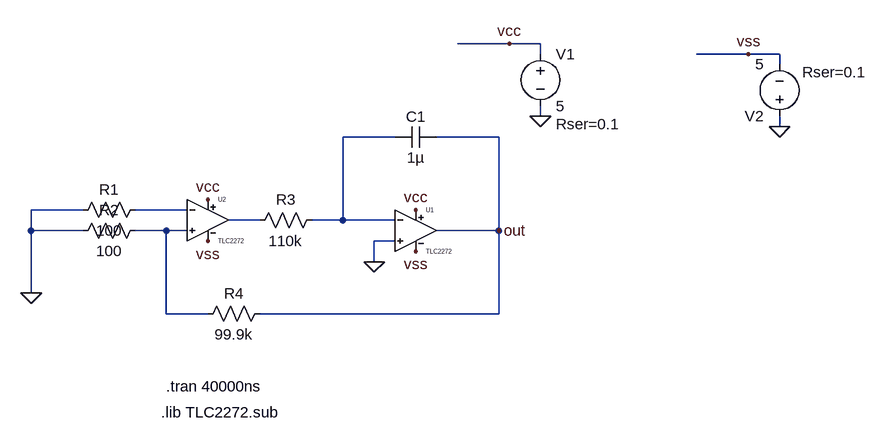
[diagram p0: schematic measure_opamp_offset.asc]
measure_opamp_offset.asc, the LTspice schematic file:
Version 4
SHEET 1 1132 680
WIRE 224 -16 144 -16
WIRE 272 -16 224 -16
WIRE 272 0 272 -16
WIRE 592 0 512 0
WIRE 640 0 592 0
WIRE 640 16 640 0
WIRE 272 96 272 80
WIRE 640 112 640 96
WIRE 48 128 -32 128
WIRE 208 128 112 128
WIRE -432 240 -512 240
WIRE -272 240 -352 240
WIRE -160 256 -208 256
WIRE -32 256 -32 128
WIRE -32 256 -80 256
WIRE 48 256 -32 256
WIRE -512 272 -512 240
WIRE -432 272 -512 272
WIRE -304 272 -352 272
WIRE -272 272 -304 272
WIRE 208 272 208 128
WIRE 208 272 112 272
WIRE 48 288 16 288
WIRE 16 320 16 288
WIRE -512 368 -512 272
WIRE -304 400 -304 272
WIRE -240 400 -304 400
WIRE 208 400 208 272
WIRE 208 400 -160 400
FLAG 272 96 0
FLAG 224 -16 vcc
FLAG 640 112 0
FLAG 592 0 vss
FLAG -512 368 0
FLAG 16 320 0
FLAG 208 272 out
FLAG -240 224 vcc
FLAG 80 240 vcc
FLAG -240 288 vss
FLAG 80 304 vss
SYMBOL voltage 272 -16 R0
WINDOW 123 0 0 Left 2
WINDOW 39 24 124 Left 2
SYMATTR SpiceLine Rser=0.1
SYMATTR InstName V1
SYMATTR Value 5
SYMBOL Opamps\\TLC2272 -240 192 R0
SYMATTR InstName U2
SYMBOL res -336 224 R90
WINDOW 0 0 56 VBottom 2
WINDOW 3 32 56 VTop 2
SYMATTR InstName R1
SYMATTR Value 100
SYMBOL res -336 256 R90
WINDOW 0 0 56 VBottom 2
WINDOW 3 32 56 VTop 2
SYMATTR InstName R2
SYMATTR Value 100
SYMBOL res -64 240 R90
WINDOW 0 0 56 VBottom 2
WINDOW 3 32 56 VTop 2
SYMATTR InstName R3
SYMATTR Value 110k
SYMBOL res -144 384 R90
WINDOW 0 0 56 VBottom 2
WINDOW 3 32 56 VTop 2
SYMATTR InstName R4
SYMATTR Value 99.9k
SYMBOL cap 112 112 R90
WINDOW 0 0 32 VBottom 2
WINDOW 3 32 32 VTop 2
SYMATTR InstName C1
SYMATTR Value 1µ
SYMBOL Opamps\\TLC2272 80 208 R0
SYMATTR InstName U1
SYMBOL voltage 640 112 R180
WINDOW 123 0 0 Left 2
WINDOW 39 -134 84 Left 2
SYMATTR SpiceLine Rser=0.1
SYMATTR InstName V2
SYMATTR Value 5
TEXT -304 512 Left 2 !.tran 40000ns
TEXT -312 552 Left 2 !.lib TLC2272.sub

The netlist it stands for:
* measure_opamp_offset.asc
V1 vcc 0 5 Rser=0.1
XU2 N004 N002 vcc vss N003 TLC2272  ; pins In+ In- V+ V- OUT
R1 N002 0 100
R2 N004 0 100
R3 N001 N003 110k
R4 out N004 99.9k
C1 out N001 1µ
XU1 0 N001 vcc vss out TLC2272  ; pins In+ In- V+ V- OUT
V2 0 vss 5 Rser=0.1
.tran 40000ns
.lib TLC2272.sub
.lib LTC.lib
.backanno
.end